# Altium schematic sheet CW341_FPGA_MGT.SchDoc: Kintex MGT Tiles
size Letter; Organization: NewAE Technology Inc.; Address1: 1083 Queen St., Suite 196; Address2: Halifax; Address3: NS; Address4: Canada B3H 0B2; DocumentNumber: .; Revision: .; SheetNumber: 5; SheetTotal: 16; SheetApproved: YES
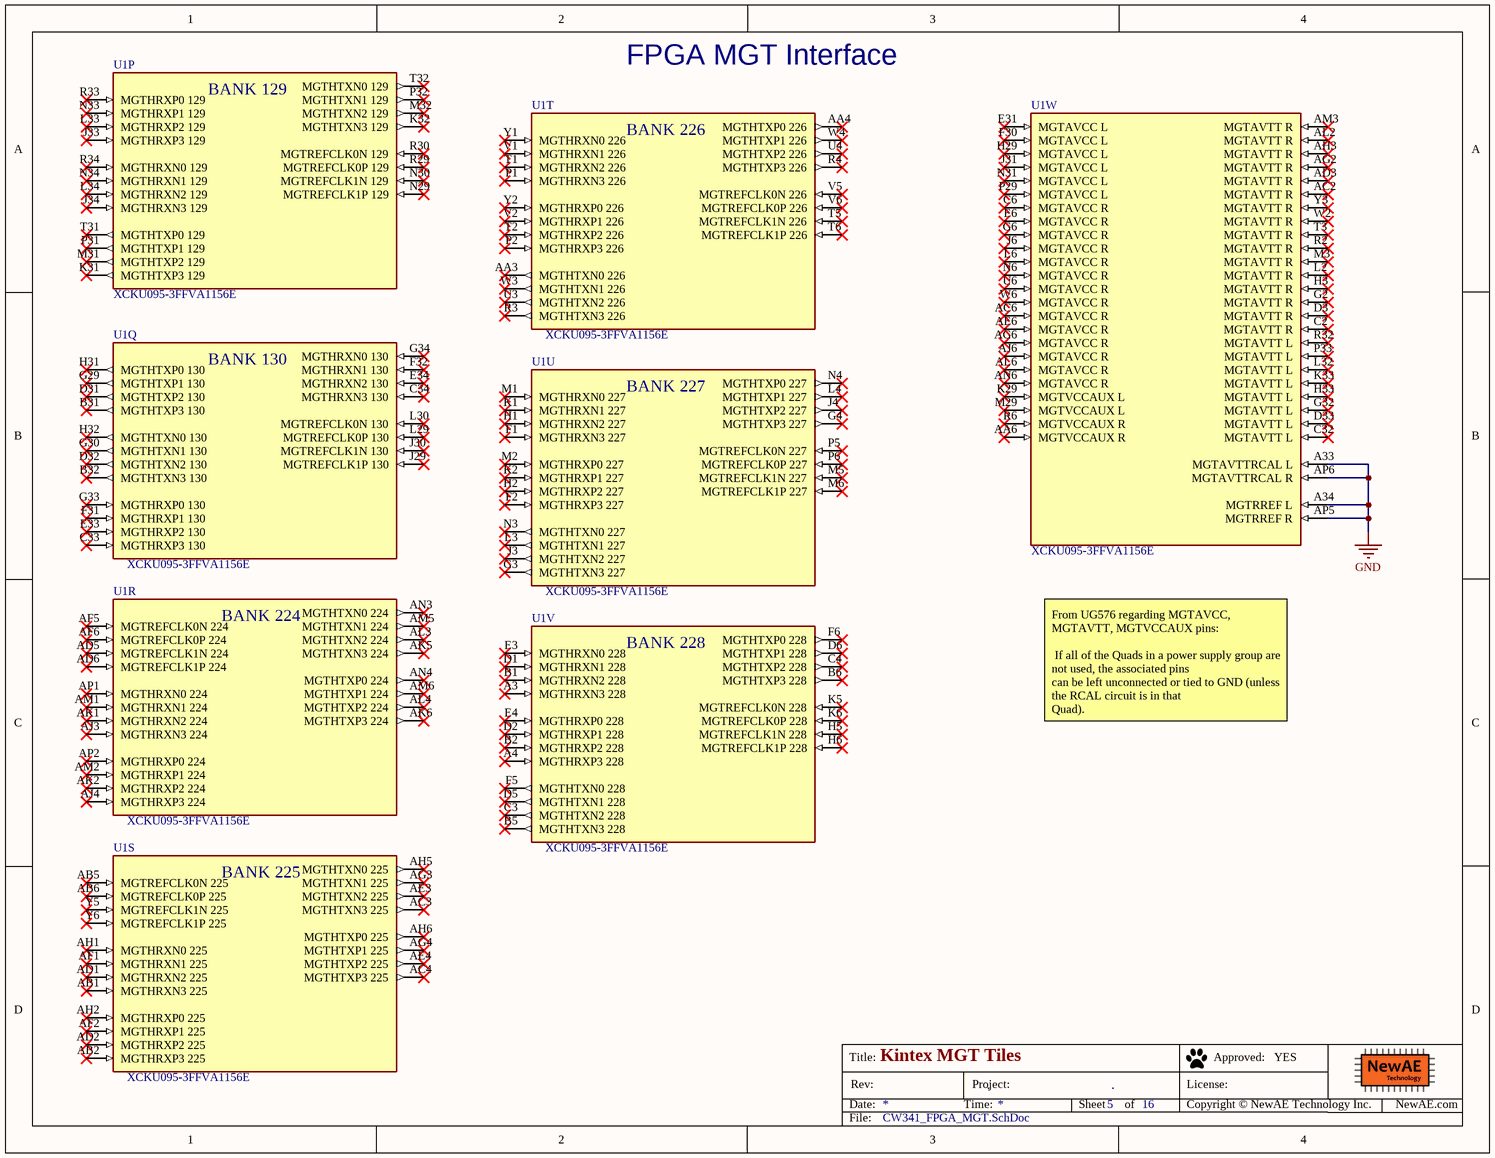
[diagram p0: CW341_FPGA_MGT.SchDoc]

## Parts
U1  XCKU095-3FFVA1156E  [FP-XCKU060-3FFVA1156E-MFG]  (parts P,Q,R,S,T,U,V,W of 23)

## Nets
GND: U1.A33(MGTAVTTRCAL_L) U1.A34(MGTRREF_L) U1.AP5(MGTRREF_R) U1.AP6(MGTAVTTRCAL_R)

Not connected (* = marked no-connect by the designer): U1 A3(MGTHRXN3_228)* A4(MGTHRXP3_228)* AA3(MGTHTXN0_226)* AA4(MGTHTXP0_226)* AA6(MGTVCCAUX_R)* AB1(MGTHRXN3_225)* AB2(MGTHRXP3_225)* AB5(MGTREFCLK0N_225)* AB6(MGTREFCLK0P_225)* AC2(MGTAVTT_R)* AC3(MGTHTXN3_225)* AC4(MGTHTXP3_225)* AC6(MGTAVCC_R)* AD1(MGTHRXN2_225)* AD2(MGTHRXP2_225)* AD3(MGTAVTT_R)* AD5(MGTREFCLK1N_224)* AD6(MGTREFCLK1P_224)* AE3(MGTHTXN2_225)* AE4(MGTHTXP2_225)* AE6(MGTAVCC_R)* AF1(MGTHRXN1_225)* AF2(MGTHRXP1_225)* AF5(MGTREFCLK0N_224)* AF6(MGTREFCLK0P_224)* AG2(MGTAVTT_R)* AG3(MGTHTXN1_225)* AG4(MGTHTXP1_225)* AG6(MGTAVCC_R)* AH1(MGTHRXN0_225)* AH2(MGTHRXP0_225)* AH3(MGTAVTT_R)* AH5(MGTHTXN0_225)* AH6(MGTHTXP0_225)* AJ3(MGTHRXN3_224)* AJ4(MGTHRXP3_224)* AJ6(MGTAVCC_R)* AK1(MGTHRXN2_224)* AK2(MGTHRXP2_224)* AK5(MGTHTXN3_224)* AK6(MGTHTXP3_224)* AL2(MGTAVTT_R)* AL3(MGTHTXN2_224)* AL4(MGTHTXP2_224)* AL6(MGTAVCC_R)* AM1(MGTHRXN1_224)* AM2(MGTHRXP1_224)* AM3(MGTAVTT_R)* AM5(MGTHTXN1_224)* AM6(MGTHTXP1_224)* AN3(MGTHTXN0_224)* AN4(MGTHTXP0_224)* AN6(MGTAVCC_R)* AP1(MGTHRXN0_224)* AP2(MGTHRXP0_224)* B1(MGTHRXN2_228)* B2(MGTHRXP2_228)* B5(MGTHTXN3_228)* B6(MGTHTXP3_228)* B31(MGTHTXP3_130)* B32(MGTHTXN3_130)* C2(MGTAVTT_R)* C3(MGTHTXN2_228)* C4(MGTHTXP2_228)* C6(MGTAVCC_R)* C32(MGTAVTT_L)* C33(MGTHRXP3_130)* C34(MGTHRXN3_130)* D1(MGTHRXN1_228)* D2(MGTHRXP1_228)* D3(MGTAVTT_R)* D5(MGTHTXN1_228)* D6(MGTHTXP1_228)* D31(MGTHTXP2_130)* D32(MGTHTXN2_130)* D33(MGTAVTT_L)* E3(MGTHRXN0_228)* E4(MGTHRXP0_228)* E6(MGTAVCC_R)* E31(MGTAVCC_L)* E33(MGTHRXP2_130)* E34(MGTHRXN2_130)* F1(MGTHRXN3_227)* F2(MGTHRXP3_227)* F5(MGTHTXN0_228)* F6(MGTHTXP0_228)* F30(MGTAVCC_L)* F31(MGTHRXP1_130)* F32(MGTHRXN1_130)* G2(MGTAVTT_R)* G3(MGTHTXN3_227)* G4(MGTHTXP3_227)* G6(MGTAVCC_R)* G29(MGTHTXP1_130)* G30(MGTHTXN1_130)* G32(MGTAVTT_L)* G33(MGTHRXP0_130)* G34(MGTHRXN0_130)* H1(MGTHRXN2_227)* H2(MGTHRXP2_227)* H3(MGTAVTT_R)* H5(MGTREFCLK1N_228)* H6(MGTREFCLK1P_228)* H29(MGTAVCC_L)* H31(MGTHTXP0_130)* H32(MGTHTXN0_130)* H33(MGTAVTT_L)* J3(MGTHTXN2_227)* J4(MGTHTXP2_227)* J6(MGTAVCC_R)* J29(MGTREFCLK1P_130)* J30(MGTREFCLK1N_130)* J31(MGTAVCC_L)* J33(MGTHRXP3_129)* J34(MGTHRXN3_129)* K1(MGTHRXN1_227)* K2(MGTHRXP1_227)* K5(MGTREFCLK0N_228)* K6(MGTREFCLK0P_228)* K29(MGTVCCAUX_L)* K31(MGTHTXP3_129)* K32(MGTHTXN3_129)* K33(MGTAVTT_L)* L2(MGTAVTT_R)* L3(MGTHTXN1_227)* L4(MGTHTXP1_227)* L6(MGTAVCC_R)* L29(MGTREFCLK0P_130)* L30(MGTREFCLK0N_130)* L32(MGTAVTT_L)* L33(MGTHRXP2_129)* L34(MGTHRXN2_129)* M1(MGTHRXN0_227)* M2(MGTHRXP0_227)* M3(MGTAVTT_R)* M5(MGTREFCLK1N_227)* M6(MGTREFCLK1P_227)* M29(MGTVCCAUX_L)* M31(MGTHTXP2_129)* M32(MGTHTXN2_129)* N3(MGTHTXN0_227)* N4(MGTHTXP0_227)* N6(MGTAVCC_R)* N29(MGTREFCLK1P_129)* N30(MGTREFCLK1N_129)* N31(MGTAVCC_L)* N33(MGTHRXP1_129)* N34(MGTHRXN1_129)* P1(MGTHRXN3_226)* P2(MGTHRXP3_226)* P5(MGTREFCLK0N_227)* P6(MGTREFCLK0P_227)* P29(MGTAVCC_L)* P31(MGTHTXP1_129)* P32(MGTHTXN1_129)* P33(MGTAVTT_L)* R2(MGTAVTT_R)* R3(MGTHTXN3_226)* R4(MGTHTXP3_226)* R6(MGTVCCAUX_R)* R29(MGTREFCLK0P_129)* R30(MGTREFCLK0N_129)* R32(MGTAVTT_L)* R33(MGTHRXP0_129)* R34(MGTHRXN0_129)* T1(MGTHRXN2_226)* T2(MGTHRXP2_226)* T3(MGTAVTT_R)* T5(MGTREFCLK1N_226)* T6(MGTREFCLK1P_226)* T31(MGTHTXP0_129)* T32(MGTHTXN0_129)* U3(MGTHTXN2_226)* U4(MGTHTXP2_226)* U6(MGTAVCC_R)* V1(MGTHRXN1_226)* V2(MGTHRXP1_226)* V5(MGTREFCLK0N_226)* V6(MGTREFCLK0P_226)* W2(MGTAVTT_R)* W3(MGTHTXN1_226)* W4(MGTHTXP1_226)* W6(MGTAVCC_R)* Y1(MGTHRXN0_226)* Y2(MGTHRXP0_226)* Y3(MGTAVTT_R)* Y5(MGTREFCLK1N_225)* Y6(MGTREFCLK1P_225)*

## Notes on the sheet
- FPGA MGT Interface
- From UG576 regarding MGTAVCC, MGTAVTT, MGTVCCAUX pins:
  If all of the Quads in a power supply group are not used, the associated pins
  can be left unconnected or tied to GND (unless the RCAL circuit is in that
  Quad).
- Title:
- Date:
- Rev:
- Time:
- Project:
- Sheet
- of
- License:
- Copyright © NewAE Technology Inc.
- Approved:
- NewAE.com
- File:
- (in symbol IC-XCKU095-1156, part P) BANK 129
- (in symbol IC-XCKU095-1156, part Q) BANK 130
- (in symbol IC-XCKU095-1156, part R) BANK 224
- (in symbol IC-XCKU095-1156, part S) BANK 225
- (in symbol IC-XCKU095-1156, part T) BANK 226
- (in symbol IC-XCKU095-1156, part U) BANK 227
- (in symbol IC-XCKU095-1156, part V) BANK 228

## Library data of the parts
U1 = IC-XCKU095-1156: IC FPGA 520 I/O 1156FCBGA; Manufacturer: Xilinx; Manufacturer Part Number: XCKU060-3FFVA1156E; Standoff Height: 0.4mm; Ram Size: 38MBytes; Min Supply Voltage: 0.97V; Max Junction Temp: +100°C; Max Supply Voltage: 1.8V; Number Of Logic Elements Cells: 1176000; Number Of I/Os: 520; Speed Grade: 3; Memory Type: RAM; Ipc Land Pattern Name: BGA1156N100P34X34_3500X3500X342; RoHS: TRUE; Height: 3.51mm; Footprint Url: https://www.xilinx.com/support/documentation/user_guides/ug575-ultrascale-pkg-pinout.pdf; Device Class L2: Embedded Processors and Controllers; ComponentLink2URL: https://www.xilinx.com/support/documentation/data_sheets/ds890-ultrascale-overview.pdf; Temperature Range High: +100°C; Device Class L1: Integrated Circuits (ICs); Package: 0; Octopart: https://octopart.com/xcku035-3ffva1156e-xilinx-67038192?r=sp; Automotive: No; ComponentLink2Description: Datasheet; Device Class L3: FPGAs - Field Programmable Gate Arrays; Category: IC; Lead Free: Yes; Temperature: 0°C to +100°C; Temperature Range Low: 0°C; Digikey Description: IC FPGA 520 I/O 1156FCBGA